# Altium project KOM_ACB23_4009.PrjPcb (part 2 of 2)
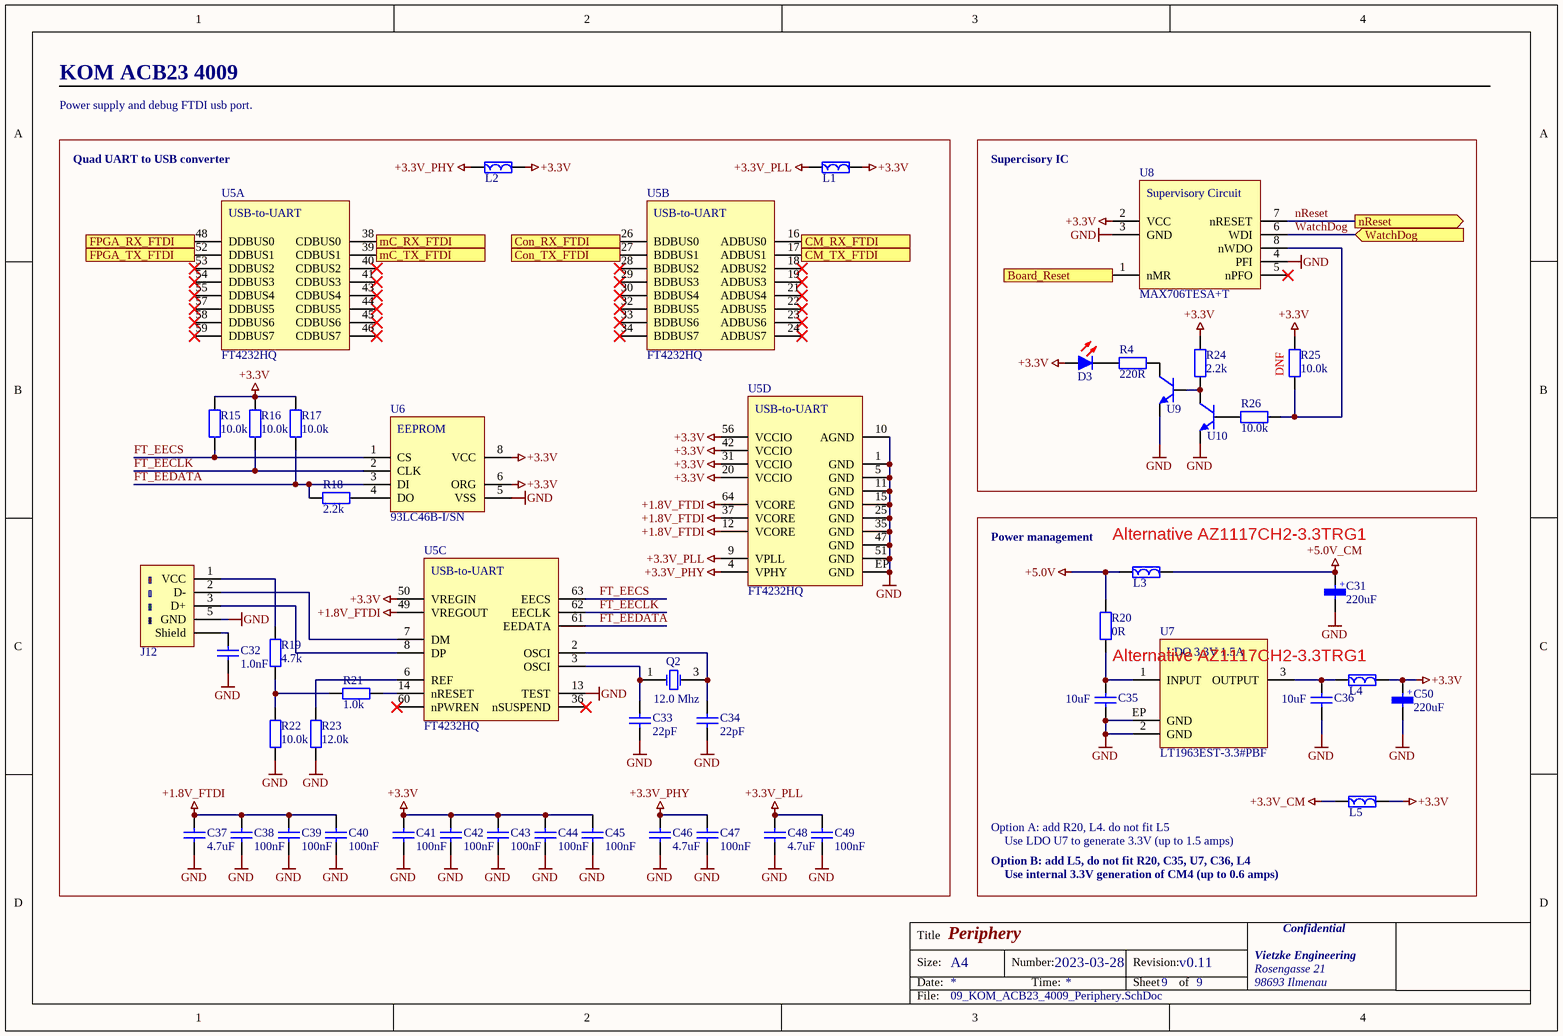
[diagram p9: 09_KOM_ACB23_4009_Periphery.SchDoc]

## Nets that join several sheets
+3.3V: 05_KOM_ACB23_4009_MicroController (8 pins), 06_KOM_ACB23_4009_FPGA (37 pins), 07_KOM_ACB23_4009_ComputeModule (15 pins), 08_KOM_ACB23_4009_Connectors (J9.5 J9.6 J11.5 J11.6), 09_KOM_ACB23_4009_Periphery (24 pins)
+3.3V_CM: 07_KOM_ACB23_4009_ComputeModule (M1.84 M1.86), 09_KOM_ACB23_4009_Periphery (L5.1)
+5.0V: 07_KOM_ACB23_4009_ComputeModule (J5.1), 08_KOM_ACB23_4009_Connectors (6 pins), 09_KOM_ACB23_4009_Periphery (L3.1 R20.2)
+5.0V_CM: 07_KOM_ACB23_4009_ComputeModule (6 pins), 09_KOM_ACB23_4009_Periphery (C31.1 L3.2)
GND: 05_KOM_ACB23_4009_MicroController (7 pins), 06_KOM_ACB23_4009_FPGA (30 pins), 07_KOM_ACB23_4009_ComputeModule (70 pins), 08_KOM_ACB23_4009_Connectors (12 pins), 09_KOM_ACB23_4009_Periphery (41 pins)
Board_Reset: 07_KOM_ACB23_4009_ComputeModule (M1.48 R14.2), 09_KOM_ACB23_4009_Periphery (U8.1)
CM_GPIO00: 07_KOM_ACB23_4009_ComputeModule (M1.30), 08_KOM_ACB23_4009_Connectors (J10.13)
CM_GPIO01: 07_KOM_ACB23_4009_ComputeModule (M1.37), 08_KOM_ACB23_4009_Connectors (J10.11)
CM_GPIO02: 07_KOM_ACB23_4009_ComputeModule (M1.29), 08_KOM_ACB23_4009_Connectors (J10.9)
CM_RX_FPGA: 06_KOM_ACB23_4009_FPGA (U2.138), 07_KOM_ACB23_4009_ComputeModule (M1.28)
CM_RX_FTDI: 07_KOM_ACB23_4009_ComputeModule (M1.34), 09_KOM_ACB23_4009_Periphery (U5.16)
CM_TX_FPGA: 06_KOM_ACB23_4009_FPGA (U2.139), 07_KOM_ACB23_4009_ComputeModule (M1.31)
CM_TX_FTDI: 07_KOM_ACB23_4009_ComputeModule (M1.54), 09_KOM_ACB23_4009_Periphery (U5.17)
Con_RX_FTDI: 07_KOM_ACB23_4009_ComputeModule (M1.51), 09_KOM_ACB23_4009_Periphery (U5.26)
Con_TX_FTDI: 07_KOM_ACB23_4009_ComputeModule (M1.55), 09_KOM_ACB23_4009_Periphery (U5.27)
FPGA_State: 06_KOM_ACB23_4009_FPGA (U2.133), 07_KOM_ACB23_4009_ComputeModule (M1.46)
FPGA_TCK: 06_KOM_ACB23_4009_FPGA (J2.4 U2.131), 07_KOM_ACB23_4009_ComputeModule (M1.25)
FPGA_TDI: 06_KOM_ACB23_4009_FPGA (J2.3 U2.136), 07_KOM_ACB23_4009_ComputeModule (M1.27)
FPGA_TDO: 06_KOM_ACB23_4009_FPGA (J2.2 U2.137), 07_KOM_ACB23_4009_ComputeModule (M1.26)
FPGA_TMS: 06_KOM_ACB23_4009_FPGA (J2.5 U2.130), 07_KOM_ACB23_4009_ComputeModule (M1.49)
mC_Boot: 05_KOM_ACB23_4009_MicroController (R1.1 U1.14), 07_KOM_ACB23_4009_ComputeModule (M1.24)
mC_GPIO_00: 05_KOM_ACB23_4009_MicroController (U1.1), 08_KOM_ACB23_4009_Connectors (J9.71)
mC_GPIO_01: 05_KOM_ACB23_4009_MicroController (U1.2), 08_KOM_ACB23_4009_Connectors (J9.69)
mC_GPIO_02: 05_KOM_ACB23_4009_MicroController (U1.3), 08_KOM_ACB23_4009_Connectors (J9.67)
mC_GPIO_03: 05_KOM_ACB23_4009_MicroController (U1.4), 08_KOM_ACB23_4009_Connectors (J9.65)
mC_GPIO_04: 05_KOM_ACB23_4009_MicroController (U1.5), 08_KOM_ACB23_4009_Connectors (J9.63)
mC_GPIO_05: 05_KOM_ACB23_4009_MicroController (U1.6), 08_KOM_ACB23_4009_Connectors (J9.61)
mC_GPIO_06: 05_KOM_ACB23_4009_MicroController (U1.7), 08_KOM_ACB23_4009_Connectors (J9.59)
mC_GPIO_07: 05_KOM_ACB23_4009_MicroController (U1.8), 08_KOM_ACB23_4009_Connectors (J9.57)
mC_GPIO_08: 05_KOM_ACB23_4009_MicroController (U1.15), 08_KOM_ACB23_4009_Connectors (J9.72)
mC_GPIO_09: 05_KOM_ACB23_4009_MicroController (U1.16), 08_KOM_ACB23_4009_Connectors (J9.70)
mC_GPIO_10: 05_KOM_ACB23_4009_MicroController (U1.19), 08_KOM_ACB23_4009_Connectors (J9.68)
mC_GPIO_11: 05_KOM_ACB23_4009_MicroController (U1.20), 08_KOM_ACB23_4009_Connectors (J9.66)
mC_GPIO_12: 05_KOM_ACB23_4009_MicroController (U1.21), 08_KOM_ACB23_4009_Connectors (J9.64)
mC_GPIO_13: 05_KOM_ACB23_4009_MicroController (U1.22), 08_KOM_ACB23_4009_Connectors (J9.62)
mC_GPIO_14: 05_KOM_ACB23_4009_MicroController (U1.23), 08_KOM_ACB23_4009_Connectors (J9.60)
mC_GPIO_15: 05_KOM_ACB23_4009_MicroController (U1.24), 08_KOM_ACB23_4009_Connectors (J9.58)
mC_RX_FPGA: 05_KOM_ACB23_4009_MicroController (U1.12), 06_KOM_ACB23_4009_FPGA (U2.140)
mC_RX_FTDI: 05_KOM_ACB23_4009_MicroController (U1.18), 09_KOM_ACB23_4009_Periphery (U5.38)
mC_State: 05_KOM_ACB23_4009_MicroController (U1.13), 07_KOM_ACB23_4009_ComputeModule (M1.41)
mC_TX_FPGA: 05_KOM_ACB23_4009_MicroController (U1.11), 06_KOM_ACB23_4009_FPGA (U2.141)
mC_TX_FTDI: 05_KOM_ACB23_4009_MicroController (U1.17), 09_KOM_ACB23_4009_Periphery (U5.39)
NetJ9_9: 06_KOM_ACB23_4009_FPGA (U2.40), 08_KOM_ACB23_4009_Connectors (J9.9)
NetJ9_10: 06_KOM_ACB23_4009_FPGA (U2.39), 08_KOM_ACB23_4009_Connectors (J9.10)
NetJ9_11: 06_KOM_ACB23_4009_FPGA (U2.38), 08_KOM_ACB23_4009_Connectors (J9.11)
NetJ9_12: 06_KOM_ACB23_4009_FPGA (U2.35), 08_KOM_ACB23_4009_Connectors (J9.12)
NetJ9_13: 06_KOM_ACB23_4009_FPGA (U2.34), 08_KOM_ACB23_4009_Connectors (J9.13)
NetJ9_14: 06_KOM_ACB23_4009_FPGA (U2.33), 08_KOM_ACB23_4009_Connectors (J9.14)
NetJ9_15: 06_KOM_ACB23_4009_FPGA (U2.32), 08_KOM_ACB23_4009_Connectors (J9.15)
NetJ9_16: 06_KOM_ACB23_4009_FPGA (U2.31), 08_KOM_ACB23_4009_Connectors (J9.16)
NetJ9_17: 06_KOM_ACB23_4009_FPGA (U2.28), 08_KOM_ACB23_4009_Connectors (J9.17)
NetJ9_18: 06_KOM_ACB23_4009_FPGA (U2.27), 08_KOM_ACB23_4009_Connectors (J9.18)
NetJ9_19: 06_KOM_ACB23_4009_FPGA (U2.26), 08_KOM_ACB23_4009_Connectors (J9.19)
NetJ9_20: 06_KOM_ACB23_4009_FPGA (U2.25), 08_KOM_ACB23_4009_Connectors (J9.20)
NetJ9_21: 06_KOM_ACB23_4009_FPGA (U2.24), 08_KOM_ACB23_4009_Connectors (J9.21)
NetJ9_22: 06_KOM_ACB23_4009_FPGA (U2.23), 08_KOM_ACB23_4009_Connectors (J9.22)
NetJ9_23: 06_KOM_ACB23_4009_FPGA (U2.22), 08_KOM_ACB23_4009_Connectors (J9.23)
NetJ9_24: 06_KOM_ACB23_4009_FPGA (U2.21), 08_KOM_ACB23_4009_Connectors (J9.24)
NetJ9_25: 06_KOM_ACB23_4009_FPGA (U2.20), 08_KOM_ACB23_4009_Connectors (J9.25)
NetJ9_26: 06_KOM_ACB23_4009_FPGA (U2.19), 08_KOM_ACB23_4009_Connectors (J9.26)
NetJ9_27: 06_KOM_ACB23_4009_FPGA (U2.17), 08_KOM_ACB23_4009_Connectors (J9.27)
NetJ9_28: 06_KOM_ACB23_4009_FPGA (U2.15), 08_KOM_ACB23_4009_Connectors (J9.28)
NetJ9_29: 06_KOM_ACB23_4009_FPGA (U2.14), 08_KOM_ACB23_4009_Connectors (J9.29)
NetJ9_30: 06_KOM_ACB23_4009_FPGA (U2.13), 08_KOM_ACB23_4009_Connectors (J9.30)
NetJ9_31: 06_KOM_ACB23_4009_FPGA (U2.12), 08_KOM_ACB23_4009_Connectors (J9.31)
NetJ9_32: 06_KOM_ACB23_4009_FPGA (U2.11), 08_KOM_ACB23_4009_Connectors (J9.32)
NetJ9_33: 06_KOM_ACB23_4009_FPGA (U2.10), 08_KOM_ACB23_4009_Connectors (J9.33)
NetJ9_34: 06_KOM_ACB23_4009_FPGA (U2.9), 08_KOM_ACB23_4009_Connectors (J9.34)
NetJ9_35: 06_KOM_ACB23_4009_FPGA (U2.6), 08_KOM_ACB23_4009_Connectors (J9.35)
NetJ9_36: 06_KOM_ACB23_4009_FPGA (U2.5), 08_KOM_ACB23_4009_Connectors (J9.36)
NetJ9_37: 06_KOM_ACB23_4009_FPGA (U2.4), 08_KOM_ACB23_4009_Connectors (J9.37)
NetJ9_38: 06_KOM_ACB23_4009_FPGA (U2.3), 08_KOM_ACB23_4009_Connectors (J9.38)
NetJ9_39: 06_KOM_ACB23_4009_FPGA (U2.2), 08_KOM_ACB23_4009_Connectors (J9.39)
NetJ9_40: 06_KOM_ACB23_4009_FPGA (U2.1), 08_KOM_ACB23_4009_Connectors (J9.40)
NetJ10_1: 06_KOM_ACB23_4009_FPGA (U2.114), 08_KOM_ACB23_4009_Connectors (J10.1)
NetJ10_2: 06_KOM_ACB23_4009_FPGA (U2.115), 08_KOM_ACB23_4009_Connectors (J10.2)
NetJ10_3: 06_KOM_ACB23_4009_FPGA (U2.117), 08_KOM_ACB23_4009_Connectors (J10.3)
NetJ10_4: 06_KOM_ACB23_4009_FPGA (U2.119), 08_KOM_ACB23_4009_Connectors (J10.4)
NetJ10_5: 06_KOM_ACB23_4009_FPGA (U2.120), 08_KOM_ACB23_4009_Connectors (J10.5)
NetJ10_6: 06_KOM_ACB23_4009_FPGA (U2.121), 08_KOM_ACB23_4009_Connectors (J10.6)
NetJ10_7: 06_KOM_ACB23_4009_FPGA (U2.122), 08_KOM_ACB23_4009_Connectors (J10.7)
NetJ10_8: 06_KOM_ACB23_4009_FPGA (U2.125), 08_KOM_ACB23_4009_Connectors (J10.8)
NetJ10_10: 06_KOM_ACB23_4009_FPGA (U2.126), 08_KOM_ACB23_4009_Connectors (J10.10)
NetJ10_12: 06_KOM_ACB23_4009_FPGA (U2.127), 08_KOM_ACB23_4009_Connectors (J10.12)
NetJ11_9: 06_KOM_ACB23_4009_FPGA (U2.112), 08_KOM_ACB23_4009_Connectors (J11.9)
NetJ11_10: 06_KOM_ACB23_4009_FPGA (U2.113), 08_KOM_ACB23_4009_Connectors (J11.10)
NetJ11_11: 06_KOM_ACB23_4009_FPGA (U2.110), 08_KOM_ACB23_4009_Connectors (J11.11)
NetJ11_12: 06_KOM_ACB23_4009_FPGA (U2.111), 08_KOM_ACB23_4009_Connectors (J11.12)
NetJ11_13: 06_KOM_ACB23_4009_FPGA (U2.107), 08_KOM_ACB23_4009_Connectors (J11.13)
NetJ11_14: 06_KOM_ACB23_4009_FPGA (U2.109), 08_KOM_ACB23_4009_Connectors (J11.14)
NetJ11_15: 06_KOM_ACB23_4009_FPGA (U2.105), 08_KOM_ACB23_4009_Connectors (J11.15)
NetJ11_16: 06_KOM_ACB23_4009_FPGA (U2.106), 08_KOM_ACB23_4009_Connectors (J11.16)
NetJ11_17: 06_KOM_ACB23_4009_FPGA (U2.103), 08_KOM_ACB23_4009_Connectors (J11.17)
NetJ11_18: 06_KOM_ACB23_4009_FPGA (U2.104), 08_KOM_ACB23_4009_Connectors (J11.18)
NetJ11_19: 06_KOM_ACB23_4009_FPGA (U2.99), 08_KOM_ACB23_4009_Connectors (J11.19)
NetJ11_20: 06_KOM_ACB23_4009_FPGA (U2.100), 08_KOM_ACB23_4009_Connectors (J11.20)
NetJ11_21: 06_KOM_ACB23_4009_FPGA (U2.97), 08_KOM_ACB23_4009_Connectors (J11.21)
NetJ11_22: 06_KOM_ACB23_4009_FPGA (U2.98), 08_KOM_ACB23_4009_Connectors (J11.22)
NetJ11_23: 06_KOM_ACB23_4009_FPGA (U2.95), 08_KOM_ACB23_4009_Connectors (J11.23)
NetJ11_24: 06_KOM_ACB23_4009_FPGA (U2.96), 08_KOM_ACB23_4009_Connectors (J11.24)
NetJ11_25: 06_KOM_ACB23_4009_FPGA (U2.93), 08_KOM_ACB23_4009_Connectors (J11.25)
NetJ11_26: 06_KOM_ACB23_4009_FPGA (U2.94), 08_KOM_ACB23_4009_Connectors (J11.26)
NetJ11_27: 06_KOM_ACB23_4009_FPGA (U2.91), 08_KOM_ACB23_4009_Connectors (J11.27)
NetJ11_28: 06_KOM_ACB23_4009_FPGA (U2.92), 08_KOM_ACB23_4009_Connectors (J11.28)
NetJ11_29: 06_KOM_ACB23_4009_FPGA (U2.87), 08_KOM_ACB23_4009_Connectors (J11.29)
NetJ11_30: 06_KOM_ACB23_4009_FPGA (U2.89), 08_KOM_ACB23_4009_Connectors (J11.30)
NetJ11_33: 06_KOM_ACB23_4009_FPGA (U2.85), 08_KOM_ACB23_4009_Connectors (J11.33)
NetJ11_34: 06_KOM_ACB23_4009_FPGA (U2.86), 08_KOM_ACB23_4009_Connectors (J11.34)
NetJ11_35: 06_KOM_ACB23_4009_FPGA (U2.83), 08_KOM_ACB23_4009_Connectors (J11.35)
NetJ11_36: 06_KOM_ACB23_4009_FPGA (U2.84), 08_KOM_ACB23_4009_Connectors (J11.36)
NetJ11_37: 06_KOM_ACB23_4009_FPGA (U2.81), 08_KOM_ACB23_4009_Connectors (J11.37)
NetJ11_38: 06_KOM_ACB23_4009_FPGA (U2.82), 08_KOM_ACB23_4009_Connectors (J11.38)
NetJ11_39: 06_KOM_ACB23_4009_FPGA (U2.77), 08_KOM_ACB23_4009_Connectors (J11.39)
NetJ11_40: 06_KOM_ACB23_4009_FPGA (U2.78), 08_KOM_ACB23_4009_Connectors (J11.40)
NetJ11_41: 06_KOM_ACB23_4009_FPGA (U2.75), 08_KOM_ACB23_4009_Connectors (J11.41)
NetJ11_42: 06_KOM_ACB23_4009_FPGA (U2.76), 08_KOM_ACB23_4009_Connectors (J11.42)
NetJ11_43: 06_KOM_ACB23_4009_FPGA (U2.73), 08_KOM_ACB23_4009_Connectors (J11.43)
NetJ11_44: 06_KOM_ACB23_4009_FPGA (U2.74), 08_KOM_ACB23_4009_Connectors (J11.44)
NetJ11_45: 06_KOM_ACB23_4009_FPGA (U2.70), 08_KOM_ACB23_4009_Connectors (J11.45)
NetJ11_46: 06_KOM_ACB23_4009_FPGA (U2.71), 08_KOM_ACB23_4009_Connectors (J11.46)
NetJ11_47: 06_KOM_ACB23_4009_FPGA (U2.68), 08_KOM_ACB23_4009_Connectors (J11.47)
NetJ11_48: 06_KOM_ACB23_4009_FPGA (U2.69), 08_KOM_ACB23_4009_Connectors (J11.48)
NetJ11_49: 06_KOM_ACB23_4009_FPGA (U2.65), 08_KOM_ACB23_4009_Connectors (J11.49)
NetJ11_50: 06_KOM_ACB23_4009_FPGA (U2.67), 08_KOM_ACB23_4009_Connectors (J11.50)
NetJ11_53: 06_KOM_ACB23_4009_FPGA (U2.62), 08_KOM_ACB23_4009_Connectors (J11.53)
NetJ11_54: 06_KOM_ACB23_4009_FPGA (U2.63), 08_KOM_ACB23_4009_Connectors (J11.54)
NetJ11_55: 06_KOM_ACB23_4009_FPGA (U2.60), 08_KOM_ACB23_4009_Connectors (J11.55)
NetJ11_56: 06_KOM_ACB23_4009_FPGA (U2.61), 08_KOM_ACB23_4009_Connectors (J11.56)
NetJ11_57: 06_KOM_ACB23_4009_FPGA (U2.58), 08_KOM_ACB23_4009_Connectors (J11.57)
NetJ11_58: 06_KOM_ACB23_4009_FPGA (U2.59), 08_KOM_ACB23_4009_Connectors (J11.58)
NetJ11_59: 06_KOM_ACB23_4009_FPGA (U2.56), 08_KOM_ACB23_4009_Connectors (J11.59)
NetJ11_60: 06_KOM_ACB23_4009_FPGA (U2.57), 08_KOM_ACB23_4009_Connectors (J11.60)
NetJ11_63: 06_KOM_ACB23_4009_FPGA (U2.52), 08_KOM_ACB23_4009_Connectors (J11.63)
NetJ11_64: 06_KOM_ACB23_4009_FPGA (U2.54), 08_KOM_ACB23_4009_Connectors (J11.64)
NetJ11_65: 06_KOM_ACB23_4009_FPGA (U2.48), 08_KOM_ACB23_4009_Connectors (J11.65)
NetJ11_66: 06_KOM_ACB23_4009_FPGA (U2.50), 08_KOM_ACB23_4009_Connectors (J11.66)
NetJ11_67: 06_KOM_ACB23_4009_FPGA (U2.45), 08_KOM_ACB23_4009_Connectors (J11.67)
NetJ11_68: 06_KOM_ACB23_4009_FPGA (U2.47), 08_KOM_ACB23_4009_Connectors (J11.68)
NetJ11_69: 06_KOM_ACB23_4009_FPGA (U2.43), 08_KOM_ACB23_4009_Connectors (J11.69)
NetJ11_70: 06_KOM_ACB23_4009_FPGA (U2.44), 08_KOM_ACB23_4009_Connectors (J11.70)
NetJ11_71: 06_KOM_ACB23_4009_FPGA (U2.41), 08_KOM_ACB23_4009_Connectors (J11.71)
NetJ11_72: 06_KOM_ACB23_4009_FPGA (U2.42), 08_KOM_ACB23_4009_Connectors (J11.72)
NetU2_142: 06_KOM_ACB23_4009_FPGA (U2.142), 09_KOM_ACB23_4009_Periphery (U5.52)
NetU2_143: 06_KOM_ACB23_4009_FPGA (U2.143), 09_KOM_ACB23_4009_Periphery (U5.48)
nReset: 05_KOM_ACB23_4009_MicroController (J1.4 U1.26), 06_KOM_ACB23_4009_FPGA (U2.55), 08_KOM_ACB23_4009_Connectors (J10.15), 09_KOM_ACB23_4009_Periphery (U8.7)
WatchDog: 07_KOM_ACB23_4009_ComputeModule (M1.50), 09_KOM_ACB23_4009_Periphery (U8.6)

## Assembly variants
Full (+3.3V by CM4): not fitted C35 C36 L4 R20 R25 U7
Full (+3.3V by LDO): not fitted L5 R25